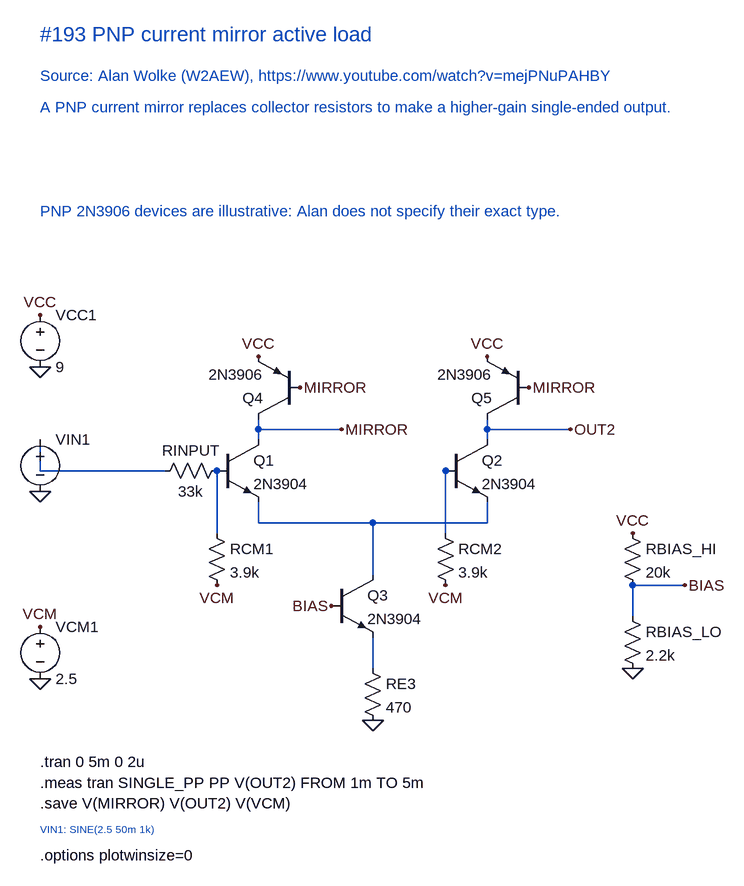
[diagram p0: schematic PNP current mirror active load.asc]
PNP current mirror active load.asc, the LTspice schematic file:
Version 4.1
SHEET 1 1320 1000
WIRE 464 192 464 176
WIRE 464 208 464 192
WIRE 592 192 464 192
WIRE 816 192 816 176
WIRE 816 208 816 192
WIRE 944 192 816 192
WIRE 464 336 464 304
WIRE 640 336 464 336
WIRE 816 336 640 336
WIRE 816 336 816 304
WIRE 400 256 400 256
WIRE 320 256 128 256
WIRE 128 256 128 208
WIRE 752 256 752 256
WIRE 400 352 400 256
WIRE 752 352 752 256
FLAG 464 80 VCC
FLAG 816 80 VCC
FLAG 592 192 MIRROR
FLAG 944 192 OUT2
FLAG 400 432 VCM
WIRE 640 416 640 336
WIRE 640 560 640 512
WIRE 1040 480 1040 432
WIRE 1120 432 1040 432
FLAG 576 464 BIAS
FLAG 528 128 MIRROR
FLAG 880 128 MIRROR
FLAG 640 640 0
FLAG 1040 352 VCC
FLAG 1120 432 BIAS
FLAG 1040 560 0
FLAG 752 432 VCM
FLAG 128 288 0
FLAG 128 16 VCC
FLAG 128 96 0
FLAG 128 496 VCM
FLAG 128 576 0
SYMBOL voltage 128 0 R0
SYMATTR InstName VCC1
SYMATTR Value 9
SYMBOL voltage 128 192 R0
WINDOW 3 0 0 Invisible 2
SYMATTR InstName VIN1
SYMATTR Value SINE(2.5 50m 1k)
SYMBOL voltage 128 480 R0
SYMATTR InstName VCM1
SYMATTR Value 2.5
SYMBOL npn 400 208 R0
SYMATTR InstName Q1
SYMATTR Value 2N3904
SYMBOL npn 752 208 R0
SYMATTR InstName Q2
SYMATTR Value 2N3904
SYMBOL res 416 240 R90
WINDOW 0 0 56 VBottom 2
WINDOW 3 32 56 VTop 2
SYMATTR InstName RINPUT
SYMATTR Value 33k
SYMBOL res 384 336 R0
SYMATTR InstName RCM1
SYMATTR Value 3.9k
SYMBOL res 736 336 R0
SYMATTR InstName RCM2
SYMATTR Value 3.9k
TEXT 128 848 Left 2 !.options plotwinsize=0
SYMBOL pnp 528 176 R180
SYMATTR InstName Q4
SYMATTR Value 2N3906
SYMBOL pnp 880 176 R180
SYMATTR InstName Q5
SYMATTR Value 2N3906
SYMBOL npn 576 416 R0
SYMATTR InstName Q3
SYMATTR Value 2N3904
SYMBOL res 624 544 R0
SYMATTR InstName RE3
SYMATTR Value 470
SYMBOL res 1024 336 R0
SYMATTR InstName RBIAS_HI
SYMATTR Value 20k
SYMBOL res 1024 464 R0
SYMATTR InstName RBIAS_LO
SYMATTR Value 2.2k
TEXT 128 704 Left 2 !.tran 0 5m 0 2u
TEXT 128 736 Left 2 !.meas tran SINGLE_PP PP V(OUT2) FROM 1m TO 5m
TEXT 128 768 Left 2 !.save V(MIRROR) V(OUT2) V(VCM)
TEXT 128 808 Left 1 ;VIN1: SINE(2.5 50m 1k)
TEXT 128 -144 Left 2 ;PNP 2N3906 devices are illustrative: Alan does not specify their exact type.
TEXT 128 -416 Left 3 ;#193 PNP current mirror active load
TEXT 128 -352 Left 2 ;Source: Alan Wolke (W2AEW), https://www.youtube.com/watch?v=mejPNuPAHBY
TEXT 128 -304 Left 2 ;A PNP current mirror replaces collector resistors to make a higher-gain single-ended output.

The netlist it stands for:
* PNP current mirror active load.asc
VCC1 VCC 0 9
VIN1 N003 0 SINE(2.5 50m 1k)
VCM1 VCM 0 2.5
Q1 MIRROR N002 N001 0 2N3904
Q2 OUT2 N004 N001 0 2N3904
RINPUT N002 N003 33k
RCM1 N002 VCM 3.9k
RCM2 N004 VCM 3.9k
Q4 MIRROR MIRROR VCC 0 2N3906
Q5 OUT2 MIRROR VCC 0 2N3906
Q3 N001 BIAS N005 0 2N3904
RE3 N005 0 470
RBIAS_HI VCC BIAS 20k
RBIAS_LO BIAS 0 2.2k
.model NPN NPN
.model PNP PNP
.lib standard.bjt
.options plotwinsize=0
.tran 0 5m 0 2u
.meas tran SINGLE_PP PP V(OUT2) FROM 1m TO 5m
.save V(MIRROR) V(OUT2) V(VCM)
* VIN1: SINE(2.5 50m 1k)
* PNP 2N3906 devices are illustrative: Alan does not specify their exact type.
* #193 PNP current mirror active load
* Source: Alan Wolke (W2AEW), https://www.youtube.com/watch?v=mejPNuPAHBY
* A PNP current mirror replaces collector resistors to make a higher-gain single-ended output.
.backanno
.end